# Altium schematic sheet Sensor-Sheet.SchDoc
size 420 x 297 mm; SheetNumber: 3; SheetTotal: 6
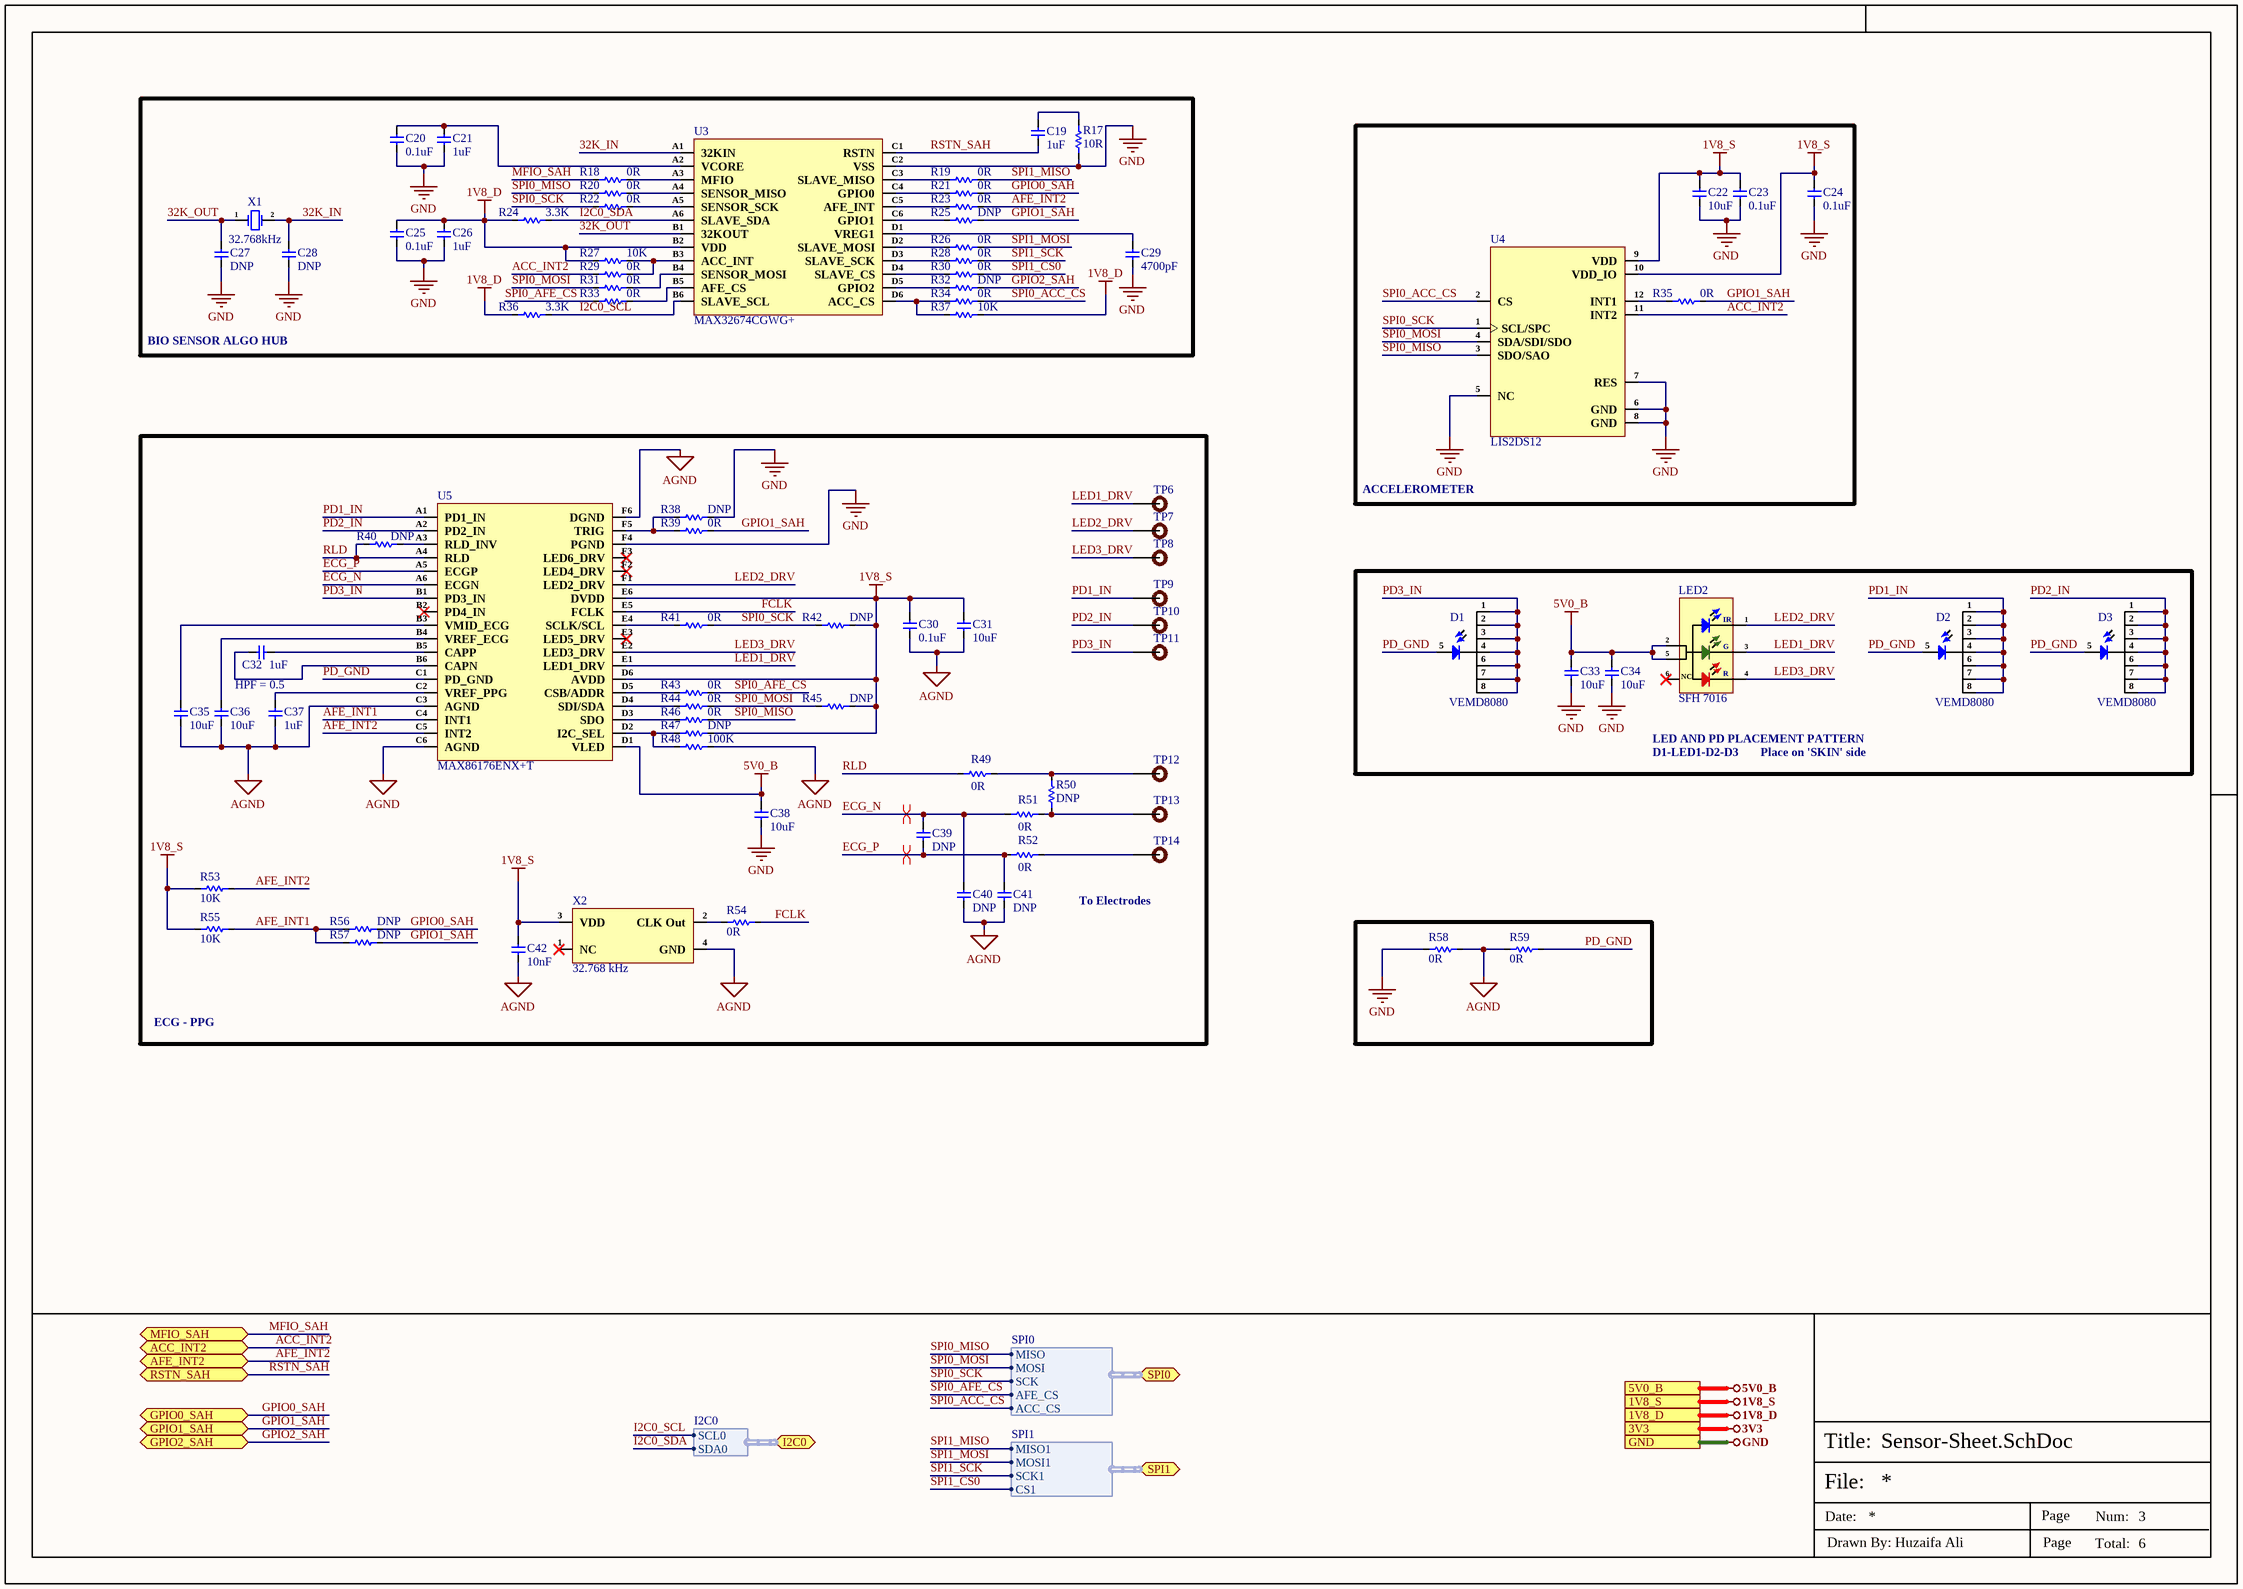
[diagram p0: Sensor-Sheet.SchDoc]

## Parts
C19  1uF  [CAP-0201]
C20  0.1uF  [CAP-0201]
C21  1uF  [CAP-0201]
C22  10uF  [Cap-0603]
C23  0.1uF  [CAP-0201]
C24  0.1uF  [CAP-0201]
C25  0.1uF  [CAP-0201]
C26  1uF  [CAP-0201]
C27  DNP  [CAP-0201]
C28  DNP  [CAP-0201]
C29  4700pF  [CAP-0201]
C30  0.1uF  [Cap-0603]
C31  10uF  [Cap-0603]
C32  1uF  [Cap-0603]
C33  10uF  [Cap-0603]
C34  10uF  [Cap-0603]
C35  10uF  [Cap-0402]
C36  10uF  [Cap-0402]
C37  1uF  [Cap-0402]
C38  10uF  [Cap-0603]
C39  DNP  [Cap-0402]
C40  DNP  [Cap-0402]
C41  DNP  [Cap-0402]
C42  10nF  [CAP-0201]
D1  VEMD8080  [VEMD8080]
D2  VEMD8080  [VEMD8080]
D3  VEMD8080  [VEMD8080]
LED2  SFH 7016  [SFH 7016]
R17  10R  [Res-0201]
R18  0R  [Res-0201]
R19  0R  [Res-0201]
R20  0R  [Res-0201]
R21  0R  [Res-0201]
R22  0R  [Res-0201]
R23  0R  [Res-0201]
R24  3.3K  [Res-0201]
R25  DNP  [Res-0201]
R26  0R  [Res-0201]
R27  10K  [Res-0201]
R28  0R  [Res-0201]
R29  0R  [Res-0201]
R30  0R  [Res-0201]
R31  0R  [Res-0201]
R32  DNP  [Res-0201]
R33  0R  [Res-0201]
R34  0R  [Res-0201]
R35  0R  [Res-0201]
R36  3.3K  [Res-0201]
R37  10K  [Res-0201]
R38  DNP  [Res-0201]
R39  0R  [Res-0201]
R40  DNP  [Res-0402]
R41  0R  [Res-0201]
R42  DNP  [Res-0402]
R43  0R  [Res-0201]
R44  0R  [Res-0201]
R45  DNP  [Res-0402]
R46  0R  [Res-0201]
R47  DNP  [Res-0402]
R48  100K  [Res-0402]
R49  0R  [Res-0201]
R50  DNP  [Res-0201]
R51  0R  [Res-0201]
R52  0R  [Res-0201]
R53  10K  [Res-0402]
R54  0R  [Res-0201]
R55  10K  [Res-0402]
R56  DNP  [Res-0201]
R57  DNP  [Res-0201]
R58  0R  [Res-1206]
R59  0R  [Res-1206]
TP6  TEST POINT 0.5mm Dia  [Test-point - 0.5mm]  (value not drawn)  (no BOM)
TP7  TEST POINT 0.5mm Dia  [Test-point - 0.5mm]  (value not drawn)  (no BOM)
TP8  TEST POINT 0.5mm Dia  [Test-point - 0.5mm]  (value not drawn)  (no BOM)
TP9  TEST POINT 0.5mm Dia  [Test-point - 0.5mm]  (value not drawn)  (no BOM)
TP10  TEST POINT 0.5mm Dia  [Test-point - 0.5mm]  (value not drawn)  (no BOM)
TP11  TEST POINT 0.5mm Dia  [Test-point - 0.5mm]  (value not drawn)  (no BOM)
TP12  TEST POINT 0.5mm Dia  [Test-point - 0.5mm]  (value not drawn)  (no BOM)
TP13  TEST POINT 0.5mm Dia  [Test-point - 0.5mm]  (value not drawn)  (no BOM)
TP14  TEST POINT 0.5mm Dia  [Test-point - 0.5mm]  (value not drawn)  (no BOM)
U3  MAX32674CGWG+  [24-WLP (2.5x1.75)]
U4  LIS2DS12  [12-LGA (2x2)]
U5  MAX86176ENX+T  [36-WLP (2.728x2.708)]
X1  32.768kHz  [SMD1610-2P]
X2  32.768 kHz  [SIT1572AI-J3-18E-DCC-32.768E]

## Blocks framed on the sheet
BIO SENSOR ALGO HUB: C19-C21 C25-C29 R17-R34 R36 R37 U3 X1
ACCELEROMETER: C22-C24 R35 U4

## Ports
1V8_D (see Top-Sheet[4B], Power-Sheet[5D]), 1V8_S (see Top-Sheet[4B], Controller-Sheet[5D], Power-Sheet[5D], Temp-Sensor-Sheet[3D]), 3V3 (see Top-Sheet[4A], Controller-Sheet[5D], Power-Sheet[5D]), 5V0_B (see Top-Sheet[4B], Controller-Sheet[5D], Power-Sheet[5D]), ACC_INT2 (bidir, see Top-Sheet[4B], Controller-Sheet[2D]), AFE_INT2 (bidir, see Top-Sheet[4B], Controller-Sheet[2D]), GND (see Top-Sheet[4A], Controller-Sheet[5D], GSM-Sheet[5D], Power-Sheet[5D], Temp-Sensor-Sheet[3D]), GPIO0_SAH (bidir, see Top-Sheet[4B], Controller-Sheet[2D]), GPIO1_SAH (bidir, see Top-Sheet[4B], Controller-Sheet[2D]), GPIO2_SAH (bidir, see Top-Sheet[4B], Controller-Sheet[2D]), I2C0 (bidir, harness I2C0, see Top-Sheet[4B], Controller-Sheet[4D]), MFIO_SAH (bidir, see Top-Sheet[4B], Controller-Sheet[2D]), RSTN_SAH (bidir, see Top-Sheet[4B], Controller-Sheet[2D]), SPI0 (bidir, harness SPI0, see Top-Sheet[4B], Controller-Sheet[3D]), SPI1 (bidir, harness SPI1, see Top-Sheet[4B], Controller-Sheet[3D])

## Harnesses
I2C0: SCL0, SDA0
SPI0: MISO, MOSI, SCK, AFE_CS, ACC_CS
SPI1: MISO1, MOSI1, SCK1, CS1

## Nets
1V8_D: C25.2 C26.2 R24.1 R27.1 R36.1 R37.2 U3.B2(VDD) ; port 1V8_D
1V8_S: C22.2 C23.2 C24.2 C30.2 C31.2 C42.2 R42.2 R45.2 R47.2 R53.1 R55.1 U4.9(VDD) U4.10(VDD_IO) U5.D6(AVDD) U5.E6(DVDD) X2.3(VDD) ; port 1V8_S
3V3: port 3V3
5V0_B: C33.2 C34.2 C38.2 LED2.2(+) LED2.5(+) U5.D1(VLED) ; port 5V0_B
AGND: C30.1 C31.1 C35.1 C36.1 C37.1 C40.2 C41.2 C42.1 R48.2 R58.2 R59.1 U5.C3(AGND) U5.C6(AGND) U5.F6(DGND) X2.4(GND)
GND: C20.1 C21.1 C22.1 C23.1 C24.1 C25.1 C26.1 C27.1 C28.1 C29.1 C33.1 C34.1 C38.1 R17.1 R38.2 R58.1 U3.C2(VSS) U4.5(NC) U4.6(GND) U4.7(RES) U4.8(GND) U5.F4(PGND) ; port GND
32K_IN: C28.2 U3.A1(32KIN) X1.2(OSC2)
32K_OUT: C27.2 U3.B1(32KOUT) X1.1(OSC1)
ACC_INT2: R29.1 U4.11(INT2) ; port ACC_INT2
AFE_INT1: R55.2 R56.1 R57.1 U5.C4(INT1)
AFE_INT2: R23.2 R53.2 U5.C5(INT2) ; port AFE_INT2
ECG_N: C39.2 C40.1 R51.1 U5.A6(ECGN)
ECG_P: C39.1 C41.1 R52.1 U5.A5(ECGP)
FCLK: R54.2 U5.E5(FCLK)
GPIO0_SAH: R21.2 R56.2 ; port GPIO0_SAH
GPIO1_SAH: R25.2 R35.2 R39.2 R57.2 ; port GPIO1_SAH
GPIO2_SAH: R32.2 ; port GPIO2_SAH
I2C0_SCL: R36.2 U3.B6(SLAVE_SCL) ; port I2C0.SCL0
I2C0_SDA: R24.2 U3.A6(SLAVE_SDA) ; port I2C0.SDA0
LED1_DRV: LED2.3(G) TP6.1 U5.E1(LED1_DRV)
LED2_DRV: LED2.1(IR) TP7.1 U5.F1(LED2_DRV)
LED3_DRV: LED2.4(R) TP8.1 U5.E2(LED3_DRV)
MFIO_SAH: R18.1 ; port MFIO_SAH
PD1_IN: D2.1(C) D2.2(C) D2.3(C) D2.4(C) D2.6(C) D2.7(C) D2.8(C) TP9.1 U5.A1(PD1_IN)
PD2_IN: D3.1(C) D3.2(C) D3.3(C) D3.4(C) D3.6(C) D3.7(C) D3.8(C) TP10.1 U5.A2(PD2_IN)
PD3_IN: D1.1(C) D1.2(C) D1.3(C) D1.4(C) D1.6(C) D1.7(C) D1.8(C) TP11.1 U5.B1(PD3_IN)
PD_GND: D1.5(A) D2.5(A) D3.5(A) R59.2 U5.C1(PD_GND)
RLD: R40.1 R49.1 U5.A4(RLD)
RSTN_SAH: C19.1 U3.C1(RSTN) ; port RSTN_SAH
SPI0_ACC_CS: R34.2 U4.2(CS) ; port SPI0.ACC_CS
SPI0_AFE_CS: R33.1 R43.2 ; port SPI0.AFE_CS
SPI0_MISO: R20.1 R46.2 U4.3(SDO/SAO) ; port SPI0.MISO
SPI0_MOSI: R31.1 R44.2 R45.1 U4.4(SDA/SDI/SDO) ; port SPI0.MOSI
SPI0_SCK: R22.1 R41.2 R42.1 U4.1(SCL/SPC) ; port SPI0.SCK
SPI1_CS0: R30.2 ; port SPI1.CS1
SPI1_MISO: R19.2 ; port SPI1.MISO1
SPI1_MOSI: R26.2 ; port SPI1.MOSI1
SPI1_SCK: R28.2 ; port SPI1.SCK1
NetC19_2: C19.2 R17.2
NetC20_2: C20.2 C21.2 U3.A2(VCORE)
NetC29_2: C29.2 U3.D1(VREG1)
NetC32_1: C32.1 U5.B6(CAPN)
NetC32_2: C32.2 U5.B5(CAPP)
NetC35_2: C35.2 U5.B3(VMID_ECG)
NetC36_2: C36.2 U5.B4(VREF_ECG)
NetC37_2: C37.2 U5.C2(VREF_PPG)
NetR18_2: R18.2 U3.A3(MFIO)
NetR19_1: R19.1 U3.C3(SLAVE_MISO)
NetR20_2: R20.2 U3.A4(SENSOR_MISO)
NetR21_1: R21.1 U3.C4(GPIO0)
NetR22_2: R22.2 U3.A5(SENSOR_SCK)
NetR23_1: R23.1 U3.C5(AFE_INT)
NetR25_1: R25.1 U3.C6(GPIO1)
NetR26_1: R26.1 U3.D2(SLAVE_MOSI)
NetR27_2: R27.2 R29.2 U3.B3(ACC_INT)
NetR28_1: R28.1 U3.D3(SLAVE_SCK)
NetR30_1: R30.1 U3.D4(SLAVE_CS)
NetR31_2: R31.2 U3.B4(SENSOR_MOSI)
NetR32_1: R32.1 U3.D5(GPIO2)
NetR33_2: R33.2 U3.B5(AFE_CS)
NetR34_1: R34.1 R37.1 U3.D6(ACC_CS)
NetR35_1: R35.1 U4.12(INT1)
NetR38_1: R38.1 R39.1 U5.F5(TRIG)
NetR40_2: R40.2 U5.A3(RLD_INV)
NetR41_1: R41.1 U5.E4(SCLK/SCL)
NetR43_1: R43.1 U5.D5(CSB/ADDR)
NetR44_1: R44.1 U5.D4(SDI/SDA)
NetR46_1: R46.1 U5.D3(SDO)
NetR47_1: R47.1 R48.1 U5.D2(I2C_SEL)
NetR49_2: R49.2 R50.2 TP12.1
NetR50_1: R50.1 R51.2 TP13.1
NetR52_2: R52.2 TP14.1
NetR54_1: R54.1 X2.2(CLK_Out)

Not connected (* = marked no-connect by the designer): LED2 6(NC)*; U5 B2(PD4_IN)* E3(LED5_DRV)* F2(LED4_DRV)* F3(LED6_DRV)*; X2 1(NC)*

## Layout directives
differential pair; net class ECG; differential pair class ECG_Pair: ECG_N, ECG_P

## Notes on the sheet
- HPF = 0.5
- LED AND PD PLACEMENT PATTERN
- D1-LED1-D2-D3
- Place on 'SKIN' side
- To Electrodes
- ECG - PPG
- File:
- Title:
- Date:
- Page
- Num:
- Total:
- Drawn By: Huzaifa Ali

## Library data of the parts
C19 C21 C26 = GRM033C81A105ME05D: CAP CER 1UF 10V X6S 0201; Manufacturer: Murata; Item Type: Capacitors; Material: 4241ConductorMaterial; Dielectric: 1541DielectricType; Supplier: Future Electronics; LCSC Part Number: C237278; Manufacturer Part Number: GRM033C81A105ME05D; RoHS: Yes; Stock: 165000; Pricing: 15000=0.0628, 30000=0.0611 (USD); Voltage Rating (DC): 10V; Height: 390um; ComponentLink1URL: http://search.murata.co.jp/Ceramy/image/img/A01X/G101/ENG/GRM033C81A105ME05-01.pdf?src-supplier=Digikey; ComponentLink1Description: http://search.murata.co.jp/Ceramy/image/img/A01X/G101/ENG/GRM033C81A105ME05-01.pdf?src-supplier=Digikey; ComponentLink2URL: https://datasheet.octopart.com/GRM033C81A105ME05D-Murata-datasheet-86813717.pdf?src-supplier=Future+Electronics; ComponentLink2Description: https://datasheet.octopart.com/GRM033C81A105ME05D-Murata-datasheet-86813717.pdf?src-supplier=Future+Electronics; ComponentLink3URL: https://datasheet.octopart.com/GRM033C81A105ME05D-Murata-datasheet-165579666.pdf?src-supplier=TME; ComponentLink3Description: https://datasheet.octopart.com/GRM033C81A105ME05D-Murata-datasheet-165579666.pdf?src-supplier=TME
C20 C23-C25 = GRM033C71C104KE14D: CAP CER 0.1UF 16V X7S 0201; Manufacturer: Murata; Item Type: Capacitors; Material: 4241ConductorMaterial; Supplier: Future Electronics; LCSC Part Number: C85923; Manufacturer Part Number: GRM033C71C104KE14D; RoHS: Yes; Stock: 15000; Pricing: 15000=0.0042, 45000=0.0041, 75000=0.004, 300000=0.0038, 450000=0.0037 (USD); ComponentLink1URL: http://www.mouser.com/ds/2/281/c02e-2905.pdf?src-supplier=Mouser; ComponentLink1Description: http://www.mouser.com/ds/2/281/c02e-2905.pdf?src-supplier=Mouser; ComponentLink2URL: http://www.farnell.com/datasheets/2867828.pdf?src-supplier=Farnell; ComponentLink2Description: http://www.farnell.com/datasheets/2867828.pdf?src-supplier=Farnell; ComponentLink3URL: http://www.farnell.com/datasheets/2867828.pdf?src-supplier=Newark; ComponentLink3Description: http://www.farnell.com/datasheets/2867828.pdf?src-supplier=Newark; ComponentLink4URL: http://www.farnell.com/datasheets/2867828.pdf?src-supplier=Element14; ComponentLink4Description: http://www.farnell.com/datasheets/2867828.pdf?src-supplier=Element14; ComponentLink5URL: https://search.murata.co.jp/Ceramy/image/img/A01X/G101/ENG/GRM033C71C104KE14-01.pdf?src-supplier=Digikey; ComponentLink5Description: https://search.murata.co.jp/Ceramy/image/img/A01X/G101/ENG/GRM033C71C104KE14-01.pdf?src-supplier=Digikey; ComponentLink6URL: https://datasheet.octopart.com/GRM033C71C104KE14D-Murata-datasheet-22122223.pdf?src-supplier=Future+Electronics; ComponentLink6Description: https://datasheet.octopart.com/GRM033C71C104KE14D-Murata-datasheet-22122223.pdf?src-supplier=Future+Electronics; ComponentLink7URL: https://datasheet.octopart.com/GRM033C71C104KE14D-Murata-datasheet-165579666.pdf?src-supplier=TME; ComponentLink7Description: https://datasheet.octopart.com/GRM033C71C104KE14D-Murata-datasheet-165579666.pdf?src-supplier=TME
C22 = GRT188R61E106ME13D: CAP CER 10UF 25V X5R 0603; Manufacturer: Murata; Item Type: Capacitors; Material: 4241ConductorMaterial; Tolerance: 20%; Supplier: Future Electronics; LCSC Part Number: C697423; Manufacturer Part Number: GRT188R61E106ME13D; RoHS: No; Stock: 444000; Pricing: 4000=0.0522, 8000=0.0514, 12000=0.0509, 20000=0.0503, 40000=0.049 (USD); Mounting Technology: Surface Mount; Case/Package: 0603; Case Code (Metric): 1608; Case Code (Imperial): 0603; Weight: 0.000917oz; Min Operating Temperature: -55°C; Max Operating Temperature: 85°C; Packaging: Cut Tape; Value: 10uF; Voltage Rating: 25V; Series: GRT; Termination: Standard; Voltage Rating (DC): 25V; Dielectric: X5R; Package Quantity: 4000; Length: 1.6mm; Width: 0.8mm; Height: 0.8mm; Ratings: AEC-Q200; RoHS Compliant: No; ComponentLink1URL: https://datasheet.octopart.com/GRT188R61E106ME13D-Murata-datasheet-149523595.pdf?src-supplier=Newark; ComponentLink1Description: https://datasheet.octopart.com/GRT188R61E106ME13D-Murata-datasheet-149523595.pdf?src-supplier=Newark; ComponentLink2URL: https://datasheet.octopart.com/GRT188R61E106ME13D-Murata-datasheet-82944876.pdf?src-supplier=Future+Electronics; ComponentLink2Description: https://datasheet.octopart.com/GRT188R61E106ME13D-Murata-datasheet-82944876.pdf?src-supplier=Future+Electronics; ComponentLink3URL: http://search.murata.co.jp/Ceramy/image/img/A01X/G101/ENG/GRT188R61E106ME13-01.pdf?src-supplier=Digikey; ComponentLink3Description: http://search.murata.co.jp/Ceramy/image/img/A01X/G101/ENG/GRT188R61E106ME13-01.pdf?src-supplier=Digikey; ComponentLink4URL: https://search.murata.co.jp/Ceramy/image/img/A01X/G101/ENG/GRT188R61E106ME13-01.pdf?src-supplier=Digikey; ComponentLink4Description: https://search.murata.co.jp/Ceramy/image/img/A01X/G101/ENG/GRT188R61E106ME13-01.pdf?src-supplier=Digikey; ComponentLink5URL: https://datasheet.octopart.com/GRT188R61E106ME13D-Murata-datasheet-165579666.pdf?src-supplier=TME; ComponentLink5Description: https://datasheet.octopart.com/GRT188R61E106ME13D-Murata-datasheet-165579666.pdf?src-supplier=TME
C27 C28 = GRM0335C1E2R0BA01D: CAP CER 2PF 25V C0G/NP0 0201; Manufacturer: Murata; Item Type: Capacitor; Supplier 1: Arrow Electronics; Manufacturer Part Number: GRM0335C1E2R0BA01D; RoHS: Yes; Category: Ceramic Capacitors; Stock 1: 65754; Pricing 1: 1=0.053, 10=0.0058, 25=0.004, 100=0.0026, 500=0.0024, 1000=0.0023, 3000=0.0022, 6000=0.0021, 15000=0.002, 30000=0.0019 (USD); ComponentLink1URL: https://datasheet.ciiva.com/29535/grm0335c1e2r0ba01-01-29535294.pdf?src-supplier=Digi-Key; ComponentLink1Description: https://datasheet.ciiva.com/29535/grm0335c1e2r0ba01-01-29535294.pdf?src-supplier=Digi-Key; Supplier Part Number 1: GRM0335C1E2R0BA01D; LCSC Part Number: C161383
C29 = GRM033R71A472KA01D: CAP CER 4700PF 10V X7R 0201; Manufacturer: Murata; Item Type: Capacitors; Material: Ceramic; Value: 4.7nF; Tolerance: 10%; Supplier: Future Electronics; LCSC Part Number: C85927; Manufacturer Part Number: GRM033R71A472KA01D; RoHS: Yes; Stock: 45000; Pricing: 15000=0.0011, 75000=0.0011, 300000=0.001, 750000=0.001, 1875000=0.0009 (USD); Mounting Technology: Surface Mount; Case/Package: 0201; Case Code (Metric): 0603; Case Code (Imperial): 0201; Min Operating Temperature: -55°C; Max Operating Temperature: 125°C; Dielectric: X7R; Package Quantity: 1; Voltage Rating: 10V; Packaging: Tape and Reel; Voltage Rating (DC): 10V; Termination: SMD/SMT; Voltage: 10V; Series: GRM; Construction: Flat; Length: 0.6mm; Width: 0.012inch; Height: 0.3mm; Thickness: 0.013inch; Depth: 0.3mm; Radiation Hardening: No; Reach SVHC Compliant: No; Lead Free: Lead Free; RoHS Compliant: Yes; ComponentLink1URL: https://datasheet.ciiva.com/129/product-129904.pdf?src-supplier=Digikey; ComponentLink1Description: https://datasheet.ciiva.com/129/product-129904.pdf?src-supplier=Digikey; ComponentLink2URL: https://datasheet.ciiva.com/129/grm033r71a472ka01-01-129903.pdf?src-supplier=Digikey; ComponentLink2Description: https://datasheet.ciiva.com/129/grm033r71a472ka01-01-129903.pdf?src-supplier=Digikey; ComponentLink3URL: https://datasheet.ciiva.com/18184/getdatasheetpartid-308657-18184073.pdf?src-supplier=Verical; ComponentLink3Description: https://datasheet.ciiva.com/18184/getdatasheetpartid-308657-18184073.pdf?src-supplier=Verical; ComponentLink4URL: https://datasheet.ciiva.com/29199/455736-da-01-en-vs-kondensator-0201-29199148.pdf?src-supplier=Conrad; ComponentLink4Description: https://datasheet.ciiva.com/29199/455736-da-01-en-vs-kondensator-0201-29199148.pdf?src-supplier=Conrad; ComponentLink5URL: https://datasheet.ciiva.com/7937/482872-7937598.pdf?src-supplier=Element14; ComponentLink5Description: https://datasheet.ciiva.com/7937/482872-7937598.pdf?src-supplier=Element14; ComponentLink6URL: https://datasheet.ciiva.com/7937/482872-7937597.pdf?src-supplier=Element14; ComponentLink6Description: https://datasheet.ciiva.com/7937/482872-7937597.pdf?src-supplier=Element14; ComponentLink7URL: https://datasheet.ciiva.com/129/grm033r71a472ka01-01-129905.pdf?src-supplier=Digikey; ComponentLink7Description: https://datasheet.ciiva.com/129/grm033r71a472ka01-01-129905.pdf?src-supplier=Digikey; ComponentLink8URL: https://datasheet.ciiva.com/11463/product-11463846.pdf?src-supplier=Avnet; ComponentLink8Description: https://datasheet.ciiva.com/11463/product-11463846.pdf?src-supplier=Avnet
C30 = CC0603KRX7R0BB104: CAP CER 0.1UF 100V X7R 0603; Manufacturer: Yageo; Capacitance: 100nF; Tolerance: 10%; Item Type: Capacitor; Supplier 1: Digi-Key; Manufacturer Part Number: CC0603KRX7R0BB104; RoHS: Yes; Category: Ceramic Capacitors; Stock 1: 60476; Pricing 1: 1=0.19000, 10=0.13500, 50=0.07680, 100=0.06370, 500=0.04466, 1000=0.03696 (USD); Mount: Surface Mount; Case/Package: 0603; Case Code (Metric): 1608; Case Code (Imperial): 0603; Weight: 7.1E-05oz; Min Operating Temperature: -55°C; Max Operating Temperature: 125°C; Package Quantity: 4000; Voltage Rating: 100V; Packaging: Tape and Reel; Dielectric: X7R; Termination: SMD/SMT; Resistor Type: Ceramic; Voltage Rating (DC): 100V; Series: CC; Length: 0.063inch; Width: 0.031inch; Thickness: 0.035inch; Depth: 0.8mm; Lead Free: Lead Free; RoHS Compliant: Yes; ComponentLink1URL: https://datasheet.ciiva.com/6277/mlccorderingcode-6277030.pdf?src-supplier=Digi-Key; ComponentLink1Description: https://datasheet.ciiva.com/6277/mlccorderingcode-6277030.pdf?src-supplier=Digi-Key; ComponentLink2URL: https://datasheet.ciiva.com/6277/mlccorderingcode-6277081.pdf?src-supplier=Digi-Key; ComponentLink2Description: https://datasheet.ciiva.com/6277/mlccorderingcode-6277081.pdf?src-supplier=Digi-Key; ComponentLink3URL: https://datasheet.ciiva.com/6277/mlccorderingcode-6277082.pdf?src-supplier=Digi-Key; ComponentLink3Description: https://datasheet.ciiva.com/6277/mlccorderingcode-6277082.pdf?src-supplier=Digi-Key; Supplier Part Number 1: 311-1523-1-ND; LCSC Part Number: C113803
C31 C33 C34 C38 = GRM188R61E106MA73J: CAP CER 10UF 25V X5R 0603; Manufacturer: Murata; Tolerance: 20%; Item Type: Capacitor; Supplier 1: Digi-Key; Manufacturer Part Number: GRM188R61E106MA73J; Stock 1: 47597; Pricing 1: 1=0.42, 10=0.293, 100=0.1756, 500=0.13172, 1000=0.11123, 2500=0.10537, 5000=0.09952 (USD); Mount: Surface Mount; Case/Package: 0603; Weight: 0.000222oz; Case Code (Metric): 1608; Case Code (Imperial): 0603; Min Operating Temperature: -55°C; Max Operating Temperature: 85°C; Packaging: Tape and Reel; Capacitance: 10uF; Voltage Rating: 25V; Dielectric: X5R; Termination: SMD/SMT; Composition: Ceramic; Voltage Rating (DC): 25V; Package Quantity: 10000; Length: 0.063inch; Height: 0.8mm; Width: 0.031inch; Thickness: 0.039inch; Supplier Part Number 1: 490-12737-1-ND; LCSC Part Number: C3833060
C32 = 0603B105K250NT: 25V 1uF X7R ±10% 0603 Multilayer Ceramic Capacitors MLCC - SMD/SMT ROHS; Manufacturer: FH; Manufacturer Part Number: 0603B105K250NT; Package: 0603; LCSC Part Number: C59302; Item Type: Capacitor; ComponentLink1Description: LCSC; ComponentLink1URL: https://www.lcsc.com/product-detail/Multilayer-Ceramic-Capacitors-MLCC-SMD-SMT_FH-Guangdong-Fenghua-Advanced-Tech-0603B105K250NT_C59302.html
C35 C36 = GRM155R61A106ME44D: 10V 10uF X5R ±20% 0402 Multilayer Ceramic Capacitors MLCC - SMD/SMT ROHS; Manufacturer: Murata; Dielectric: 1537DielectricType; Supplier: LCSC; LCSC Part Number: C77000; Manufacturer Part Number: GRM155R61A106ME44D; RoHS: Yes; Item Type: Capacitors; Stock: 574805; Pricing: 50=0.0103, 500=0.008, 1500=0.0068, 10000=0.0056, 50000=0.0055 (USD); Case/Package: 343Case; Value: 10uF; Voltage Rating (DC): 10V; Length: 1mm; Width: 500um; Thickness: 500um
C37 = CL05A105KO5NNNC: CAP CER 1UF 16V X5R 0402; Manufacturer: Samsung; Item Type: Capacitors; Material: 4241ConductorMaterial; Tolerance: 10%; Supplier: Avnet; LCSC Part Number: C29266; Manufacturer Part Number: CL05A105KO5NNNC; RoHS: Yes; Stock: 440000; Pricing: 10000=0.00432, 20000=0.00423, 40000=0.00413, 60000=0.00403, 80000=0.00393 (USD); Mounting Technology: Surface Mount; Case/Package: 0402; Case Code (Metric): 1005; Case Code (Imperial): 0402; Min Operating Temperature: -55°C; Max Operating Temperature: 85°C; Value: 1uF; Dielectric: X5R; Packaging: Tape and Reel; Package Quantity: 1; Voltage Rating: 16V; Voltage: 16V; Series: CL; Construction: Flat; Voltage Rating (DC): 16V; Length: 1mm; Width: 0.02inch; Height: 0.5mm; Thickness: 0.022inch; Depth: 0.5mm; Radiation Hardening: No; RoHS Compliant: Yes; ComponentLink1URL: https://datasheet.ciiva.com/16207/cl05a105ko5nnnc-16207571.pdf?src-supplier=Future+Electronics; ComponentLink1Description: https://datasheet.ciiva.com/16207/cl05a105ko5nnnc-16207571.pdf?src-supplier=Future+Electronics; ComponentLink2URL: https://datasheet.ciiva.com/15195/getdatasheetpartid-355272-15195629.pdf?src-supplier=Verical; ComponentLink2Description: https://datasheet.ciiva.com/15195/getdatasheetpartid-355272-15195629.pdf?src-supplier=Verical
C39-C41 = CC0402JRX7R9BB104: CAP 0402 50V 100 NF X7R; Manufacturer: Yageo; Value: 100nF; Dielectric: 1511DielectricType; Item Type: Capacitor; Supplier: Digi-Key; Supplier Part Number: 13-CC0402JRX7R9BB104TR-ND; Manufacturer Part Number: CC0402JRX7R9BB104; RoHS: No; Category: Ceramic Capacitors; Pricing: 10000=0.0157 (USD); Case/Package: 343Case; Voltage Rating (DC): 50V; Lead Free: 5697LeadFree; LCSC Part Number: C5182432
C42 = GRM033R71A103KA01D: CAP CER 10000PF 10V X7R 0201; Manufacturer: Murata; Item Type: Capacitors; Material: Ceramic; Tolerance: 10%; Supplier: Mouser; LCSC Part Number: C76941; Manufacturer Part Number: GRM033R71A103KA01D; RoHS: Yes; Stock: 253762; Pricing: 1=0.1, 10=0.006, 50=0.006, 100=0.004, 1000=0.004, 10000=0.004 (USD); Mounting Technology: Surface Mount; Case/Package: 0201; Case Code (Metric): 0603; Case Code (Imperial): 0201; Min Operating Temperature: -55°C; Max Operating Temperature: 125°C; Value: 10nF; Dielectric: X7R; Voltage Rating: 10V; Packaging: Tape and Reel; Package Quantity: 1; Termination: SMD/SMT; Voltage: 10V; Series: GRM; Construction: Flat; Voltage Rating (DC): 10V; Length: 0.6mm; Width: 0.012inch; Height: 0.3mm; Thickness: 0.013inch; Depth: 0.3mm; Radiation Hardening: No; Reach SVHC Compliant: No; RoHS Compliant: Yes; Lead Free: 5697LeadFree; ComponentLink1URL: https://datasheet.ciiva.com/129/grm033r71a103ka01-01-129814.pdf?src-supplier=Digikey; ComponentLink1Description: https://datasheet.ciiva.com/129/grm033r71a103ka01-01-129814.pdf?src-supplier=Digikey; ComponentLink2URL: https://datasheet.ciiva.com/129/grm033r71a103ka01-01-129815.pdf?src-supplier=Digikey; ComponentLink2Description: https://datasheet.ciiva.com/129/grm033r71a103ka01-01-129815.pdf?src-supplier=Digikey; ComponentLink3URL: https://datasheet.ciiva.com/11789/0900766b80ef921d-11789049.pdf?src-supplier=Rs; ComponentLink3Description: https://datasheet.ciiva.com/11789/0900766b80ef921d-11789049.pdf?src-supplier=Rs; ComponentLink4URL: https://datasheet.ciiva.com/16467/product-16467346.pdf?src-supplier=Future+Electronics; ComponentLink4Description: https://datasheet.ciiva.com/16467/product-16467346.pdf?src-supplier=Future+Electronics; ComponentLink5URL: https://datasheet.ciiva.com/18184/getdatasheetpartid-158821-18184066.pdf?src-supplier=Verical; ComponentLink5Description: https://datasheet.ciiva.com/18184/getdatasheetpartid-158821-18184066.pdf?src-supplier=Verical; ComponentLink6URL: https://datasheet.ciiva.com/29199/455719-da-01-en-vs-kondensator-0201-29199284.pdf?src-supplier=Conrad; ComponentLink6Description: https://datasheet.ciiva.com/29199/455719-da-01-en-vs-kondensator-0201-29199284.pdf?src-supplier=Conrad; ComponentLink7URL: https://datasheet.ciiva.com/5422/product-5422667.pdf?src-supplier=Mouser; ComponentLink7Description: https://datasheet.ciiva.com/5422/product-5422667.pdf?src-supplier=Mouser
D1-D3 = VEMD8080: VEMD Series 850 nM ±65° Surface Mount Silicon PIN Photodiode; Manufacturer: Vishay Semiconductors; Item Type: Photodiodes; Supplier: Mouser; LCSC Part Number: C511402; Manufacturer Part Number: VEMD8080; Stock: 45223; Pricing: 1=2.18, 10=1.51, 50=1.51, 100=1.16, 1000=0.89, 10000=0.796 (USD); ComponentLink1URL: https://www.vishay.com/docs/84565/vemd8080.pdf?src-supplier=Digikey; ComponentLink1Description: https://www.vishay.com/docs/84565/vemd8080.pdf?src-supplier=Digikey; ComponentLink2URL: https://datasheet.octopart.com/VEMD8080-Vishay-datasheet-117816384.pdf?src-supplier=Future+Electronics; ComponentLink2Description: https://datasheet.octopart.com/VEMD8080-Vishay-datasheet-117816384.pdf?src-supplier=Future+Electronics
LED2 = SFH 7016: Infrared Emitters Green / Red / IR LED 530nm, 655nm, 940nm; Manufacturer: Osram Opto; Item Type: LEDs; Color: 49,52Colour; Forward Current: 20mA; Reverse Voltage: 5V; Viewing Angle: 120°; Supplier: Mouser; Supplier Part Number: 720-SFH7016; Manufacturer Part Number: SFH 7016; RoHS: Yes; Stock: 14170; Pricing: 1=1.67, 10=1.06, 50=1.06, 100=0.782, 1000=0.696, 10000=0.637 (USD); Min Operating Temperature: -40°C; Max Operating Temperature: 85°C; Length: 2.5mm; Width: 1.6mm; Height: 550um
R17 = 0201WMF100JTEE: 50mW Thick Film Resistors 25V ±1% ±200ppm/℃ 10Ω 0201 Chip Resistor - Surface Mount ROHS; Manufacturer: UNI-ROYAL; Manufacturer Part Number: 0201WMF100JTEE; Package: 0201; LCSC Part Number: C270817; Item Type: Resistor; ComponentLink1Description: LCSC; ComponentLink1URL: https://www.lcsc.com/product-detail/Chip-Resistor-Surface-Mount_UNI-ROYAL-Uniroyal-Elec-0201WMF100JTEE_C270817.html
R18-R23 R25 R26 R28-R35 R38 R39 R41 R43 R44 R46 R49-R52 R54 R56 R57 = 0201WMF0000TEE: 50mW Thick Film Resistors 25V ±1% 0Ω 0201 Chip Resistor - Surface Mount ROHS; Manufacturer: UNI-ROYAL; Manufacturer Part Number: 0201WMF0000TEE; Package: 0201; LCSC Part Number: C473473; Item Type: Resistor; ComponentLink1Description: LCSC; ComponentLink1URL: https://www.lcsc.com/product-detail/Chip-Resistor-Surface-Mount_UNI-ROYAL-Uniroyal-Elec-0201WMF0000TEE_C473473.html
R24 R36 = RC0201FR-073K3L: RES 3.3K OHM 1% 1/20W 0201; Manufacturer: Yageo; Item Type: Resistor; Supplier: Future Electronics; Supplier Part Number: 1068525; Manufacturer Part Number: RC0201FR-073K3L; RoHS: Yes; Category: Chip SMD Resistors; Stock: 40000; Pricing: 10000=0.0009, 50000=0.0013, 100000=0.0008, 250000=0.0013, 400000=0.0008, 750000=0.0012, 1500000=0.0007, 2000000=0.0011, 5000000=0.0007 (USD); ComponentLink1URL: https://datasheet.ciiva.com/14985/pyu-r-int-thick-7-14985418.pdf?src-supplier=Digi-Key; ComponentLink1Description: https://datasheet.ciiva.com/14985/pyu-r-int-thick-7-14985418.pdf?src-supplier=Digi-Key; ComponentLink2URL: https://datasheet.ciiva.com/22698/1563626-22698524.pdf?src-supplier=Element14; ComponentLink2Description: https://datasheet.ciiva.com/22698/1563626-22698524.pdf?src-supplier=Element14; LCSC Part Number: C274874
R27 R37 = 0201WMF1002TEE: 50mW Thick Film Resistors 25V ±1% ±200ppm/℃ 10kΩ 0201 Chip Resistor - Surface Mount ROHS; Manufacturer: UNI-ROYAL; Manufacturer Part Number: 0201WMF1002TEE; Package: 0201; LCSC Part Number: C473048; Item Type: Resistor; ComponentLink1Description: LCSC; ComponentLink1URL: https://www.lcsc.com/product-detail/Chip-Resistor-Surface-Mount_UNI-ROYAL-Uniroyal-Elec-0201WMF1002TEE_C473048.html
R40 = RC0402FR-070RL: 1/16W 0402; Manufacturer: Yageo; Item Type: Resistors; Resistance: 0R; Tolerance: 1%; Power Rating: 62.5mW; Voltage Rating: 50V; Temperature Coefficient: 200ppm/°C; Max Power Dissipation: 63mW; Supplier 1: Mouser; Manufacturer Part Number: RC0402FR-070RL; RoHS: Yes; Stock 1: 8556842; Pricing 1: 1=0.10000, 10=0.01400, 50=0.01400, 100=0.00600, 1000=0.00300, 5000=0.00200, 10000=0.00100 (USD); Mount: Surface Mount; Case/Package: 0402; Contact Plating: Tin,Matte; Case Code (Imperial): 0402; Case Code (Metric): 1005; Size Code: 0402; Min Operating Temperature: -55°C; Max Operating Temperature: 155°C; Resistor Type: Thick Film; Packaging: Tape and Reel; Termination: SMD/SMT; Features: Moisture Resistant; Series: RC; Number of Terminations: 2; Length: 1mm; Width: 0.5mm; Height: 0.35mm; Radiation Hardening: No; Lead Free: Lead Free; RoHS Compliant: Yes; ComponentLink1URL: https://datasheet.ciiva.com/8896/pyu-rc0402-51-rohs-l-6-8896149.pdf?src-supplier=Avnet; ComponentLink1Description: https://datasheet.ciiva.com/8896/pyu-rc0402-51-rohs-l-6-8896149.pdf?src-supplier=Avnet; ComponentLink2URL: https://datasheet.ciiva.com/16790/pyu-rc0402-51-rohs-l-6-r-16790444.pdf?src-supplier=Future+Electronics; ComponentLink2Description: https://datasheet.ciiva.com/16790/pyu-rc0402-51-rohs-l-6-r-16790444.pdf?src-supplier=Future+Electronics; Supplier Part Number 1: 603-RC0402FR-070RL; LCSC Part Number: C106231
R42 R45 R53 R55 = MR04X1002FTL: 100mW Thick Film Resistors 50V ±100ppm/℃ ±1% 10kΩ 0402 Chip Resistor - Surface Mount ROHS; Manufacturer: Walsin Tech Corp; Manufacturer Part Number: MR04X1002FTL; Package: 0402; LCSC Part Number: C327797; Item Type: Resistor; ComponentLink1Description: LCSC; ComponentLink1URL: https://www.lcsc.com/product-detail/Chip-Resistor-Surface-Mount_Walsin-Tech-Corp-MR04X1002FTL_C327797.html
R47 R48 = HP02WAF1003TCE: 100mW Thick Film Resistors 50V ±100ppm/℃ ±1% 100kΩ 0402 Chip Resistor - Surface Mount ROHS; Manufacturer: UNI-ROYAL; Manufacturer Part Number: HP02WAF1003TCE; Package: 0402; LCSC Part Number: C2759534; Item Type: Resistor; ComponentLink1Description: LCSC; ComponentLink1URL: https://www.lcsc.com/product-detail/Chip-Resistor-Surface-Mount_UNI-ROYAL-Uniroyal-Elec-HP02WAF1003TCE_C2759534.html
R58 R59 = RC1206JR-070RL: RES 0 OHM JUMPER 1/4W 1206; Manufacturer: Yageo; Item Type: Resistors; Value: 0mR; Tolerance: 5%; Power Rating: 250mW; Voltage Rating: 200V; Temperature Coefficient: 200ppm/°C; Supplier: Future Electronics; Supplier Part Number: 1414689; Manufacturer Part Number: RC1206JR-070RL; RoHS: Yes; Stock: 1115000; Pricing: 5000=0.0025, 15000=0.0039, 25000=0.0023, 50000=0.0037, 100000=0.0022, 200000=0.0035, 250000=0.0021, 625000=0.002 (USD); Case/Package: 1206; Contact Plating: Tin,Matte; Case Code (Metric): 3216; Case Code (Imperial): 1206; Min Operating Temperature: -55°C; Max Operating Temperature: 155°C; Resistor Type: Thick Film,Carbon Film; Packaging: Tape and Reel; Package Quantity: 1; Number of Terminations: 2; Termination: SMD/SMT; Max Power Dissipation: 250mW; Series: RC; Resistance Tolerance: 5%; Technology: THICK FILM; Features: Moisture Resistant; Length: 0.122inch; Width: 0.063inch; Height: 0.026inch; Depth: 1.6mm; RoHS Compliant: Yes; Reach SVHC Compliant: Unknown; Lead Free: 5697LeadFree; ComponentLink1URL: https://datasheet.ciiva.com/11808/0900766b80c6630a-11808156.pdf?src-supplier=Rs; ComponentLink1Description: https://datasheet.ciiva.com/11808/0900766b80c6630a-11808156.pdf?src-supplier=Rs; ComponentLink2URL: https://datasheet.ciiva.com/29181/402222-da-01-en-smd-widerstand-0-ohm-1206-29181568.pdf?src-supplier=Conrad; ComponentLink2Description: https://datasheet.ciiva.com/29181/402222-da-01-en-smd-widerstand-0-ohm-1206-29181568.pdf?src-supplier=Conrad; ComponentLink3URL: https://datasheet.ciiva.com/7983/444357-7983807.pdf?src-supplier=Element14; ComponentLink3Description: https://datasheet.ciiva.com/7983/444357-7983807.pdf?src-supplier=Element14; ComponentLink4URL: https://datasheet.ciiva.com/22747/1692832-22747541.pdf?src-supplier=Element14; ComponentLink4Description: https://datasheet.ciiva.com/22747/1692832-22747541.pdf?src-supplier=Element14; ComponentLink5URL: https://datasheet.ciiva.com/46445/444357-46445719.pdf?src-supplier=Element14; ComponentLink5Description: https://datasheet.ciiva.com/46445/444357-46445719.pdf?src-supplier=Element14; ComponentLink6URL: https://datasheet.ciiva.com/2458/pyu-rc1206-51-rohs-l-4-2458669.pdf?src-supplier=Digikey; ComponentLink6Description: https://datasheet.ciiva.com/2458/pyu-rc1206-51-rohs-l-4-2458669.pdf?src-supplier=Digikey; ComponentLink7URL: https://datasheet.ciiva.com/2458/pyu-rc1206-51-rohs-l-4-2458670.pdf?src-supplier=Digikey; ComponentLink7Description: https://datasheet.ciiva.com/2458/pyu-rc1206-51-rohs-l-4-2458670.pdf?src-supplier=Digikey; ComponentLink8URL: https://datasheet.ciiva.com/2458/pyu-rc1206-51-rohs-l-4-2458668.pdf?src-supplier=Digikey; ComponentLink8Description: https://datasheet.ciiva.com/2458/pyu-rc1206-51-rohs-l-4-2458668.pdf?src-supplier=Digikey; ComponentLink9URL: https://datasheet.ciiva.com/7857/1692832-7857422.pdf?src-supplier=Element14; ComponentLink9Description: https://datasheet.ciiva.com/7857/1692832-7857422.pdf?src-supplier=Element14; ComponentLink10URL: https://datasheet.ciiva.com/7857/1692832-7857421.pdf?src-supplier=Element14; ComponentLink10Description: https://datasheet.ciiva.com/7857/1692832-7857421.pdf?src-supplier=Element14; ComponentLink11URL: https://datasheet.ciiva.com/17035/pyu-rc1206-51-rohs-l-4-17035512.pdf?src-supplier=Future+Electronics; ComponentLink11Description: https://datasheet.ciiva.com/17035/pyu-rc1206-51-rohs-l-4-17035512.pdf?src-supplier=Future+Electronics
TP6-TP14 = TEST POINT 0.5mm Dia: Test Point ON; Item Type: Test Point; Manufacturer Part Number: TEST POINT 0.5mm Dia
U3 = MAX32674CGWG+: SENSOR/ALGORITHM HUB; Manufacturer: Analog Devices; Item Type: IC; Supplier: Digikey; Supplier Part Number: 175-MAX32674CGWG+TR-ND; Manufacturer Part Number: MAX32674CGWG+; RoHS: No
U4 = LIS2DS12: ACCEL 2-16G I2C/SPI 12LGA; Manufacturer: STMicroelectronics; Item Type: Accelerometers; Supplier: Avnet; LCSC Part Number: C5337244; Manufacturer Part Number: LIS2DS12; RoHS: Yes; Stock: 1431; Pricing: 1=1.9, 10=1.61, 100=1.29, 500=1.2, 1000=1.07 (USD); ComponentLink1URL: http://www.farnell.com/datasheets/2028148.pdf?src-supplier=Farnell; ComponentLink1Description: http://www.farnell.com/datasheets/2028148.pdf?src-supplier=Farnell; ComponentLink2URL: https://datasheet.octopart.com/LIS2DS12-STMicroelectronics-datasheet-62333086.pdf?src-supplier=Element14; ComponentLink2Description: https://datasheet.octopart.com/LIS2DS12-STMicroelectronics-datasheet-62333086.pdf?src-supplier=Element14; ComponentLink3URL: http://www.farnell.com/datasheets/2028148.pdf?src-supplier=Newark; ComponentLink3Description: http://www.farnell.com/datasheets/2028148.pdf?src-supplier=Newark
U5 = MAX86176ENX+T: Ultra-Low-Power, Optical PPG and Single-Lead ECG AFE; Manufacturer: Analog Devices; Item Type: IC; Supplier: Digikey; Manufacturer Part Number: MAX86176ENX+T; ComponentLink1Description: LCSC; ComponentLink1URL: https://www.lcsc.com/product-detail/Specialized-Sensors_Analog-Devices-Inc-Maxim-Integrated-MAX86176ENX-T_C3197546.html
X1 = CM1610H32768DZBT: CRYSTAL 32.7680KHZ 6PF SMD; Manufacturer: CITIZEN; Item Type: Crystals; Manufacturer Part Number: CM1610H32768DZBT; Package: SMD1610-2P; LCSC Part Number: C1985673; ComponentLink1Description: LCSC; ComponentLink1URL: https://www.lcsc.com/product-detail/Crystals_CITIZEN-CM1610H32768DZBT_C1985673.html
X2 = SIT1572AI-J3-18E-DCC-32.768E: MEMS OSC XO 32.7680KHZ LVCMOS; Manufacturer: SiTime; Item Type: Oscillators; Frequency Stability: 50ppm; Max Supply Current: 5.3uA; Supplier: Digikey; LCSC Part Number: C1988615; Manufacturer Part Number: SIT1572AI-J3-18E-DCC-32.768E; RoHS: Yes; Stock: 1183; Pricing: 1=1.91, 10=1.646, 50=1.4844, 100=1.4202, 500=1.28206 (USD); Mounting Technology: Surface Mount; Min Operating Temperature: -40°C; Max Operating Temperature: 85°C; Series: SiT1572; Packaging: Cut Tape; Frequency: 32.768kHz; RoHS Compliant: Yes; ComponentLink1URL: https://www.sitime.com/datasheet/SiT1572?src-supplier=Digikey; ComponentLink1Description: https://www.sitime.com/datasheet/SiT1572?src-supplier=Digikey